# EasyEDA Pro project KEYBOARD_V2.eprj, schematic Schematic1
Board Name: Board1; Create Date: 2026-10-05; Page Name: P1; Project Name: KEYBOARD_V2; Schematic Name: Schematic1; Update Date: 2026-10-07; Company: 嘉立创EDA; Page Size: A4; Version: V1.0
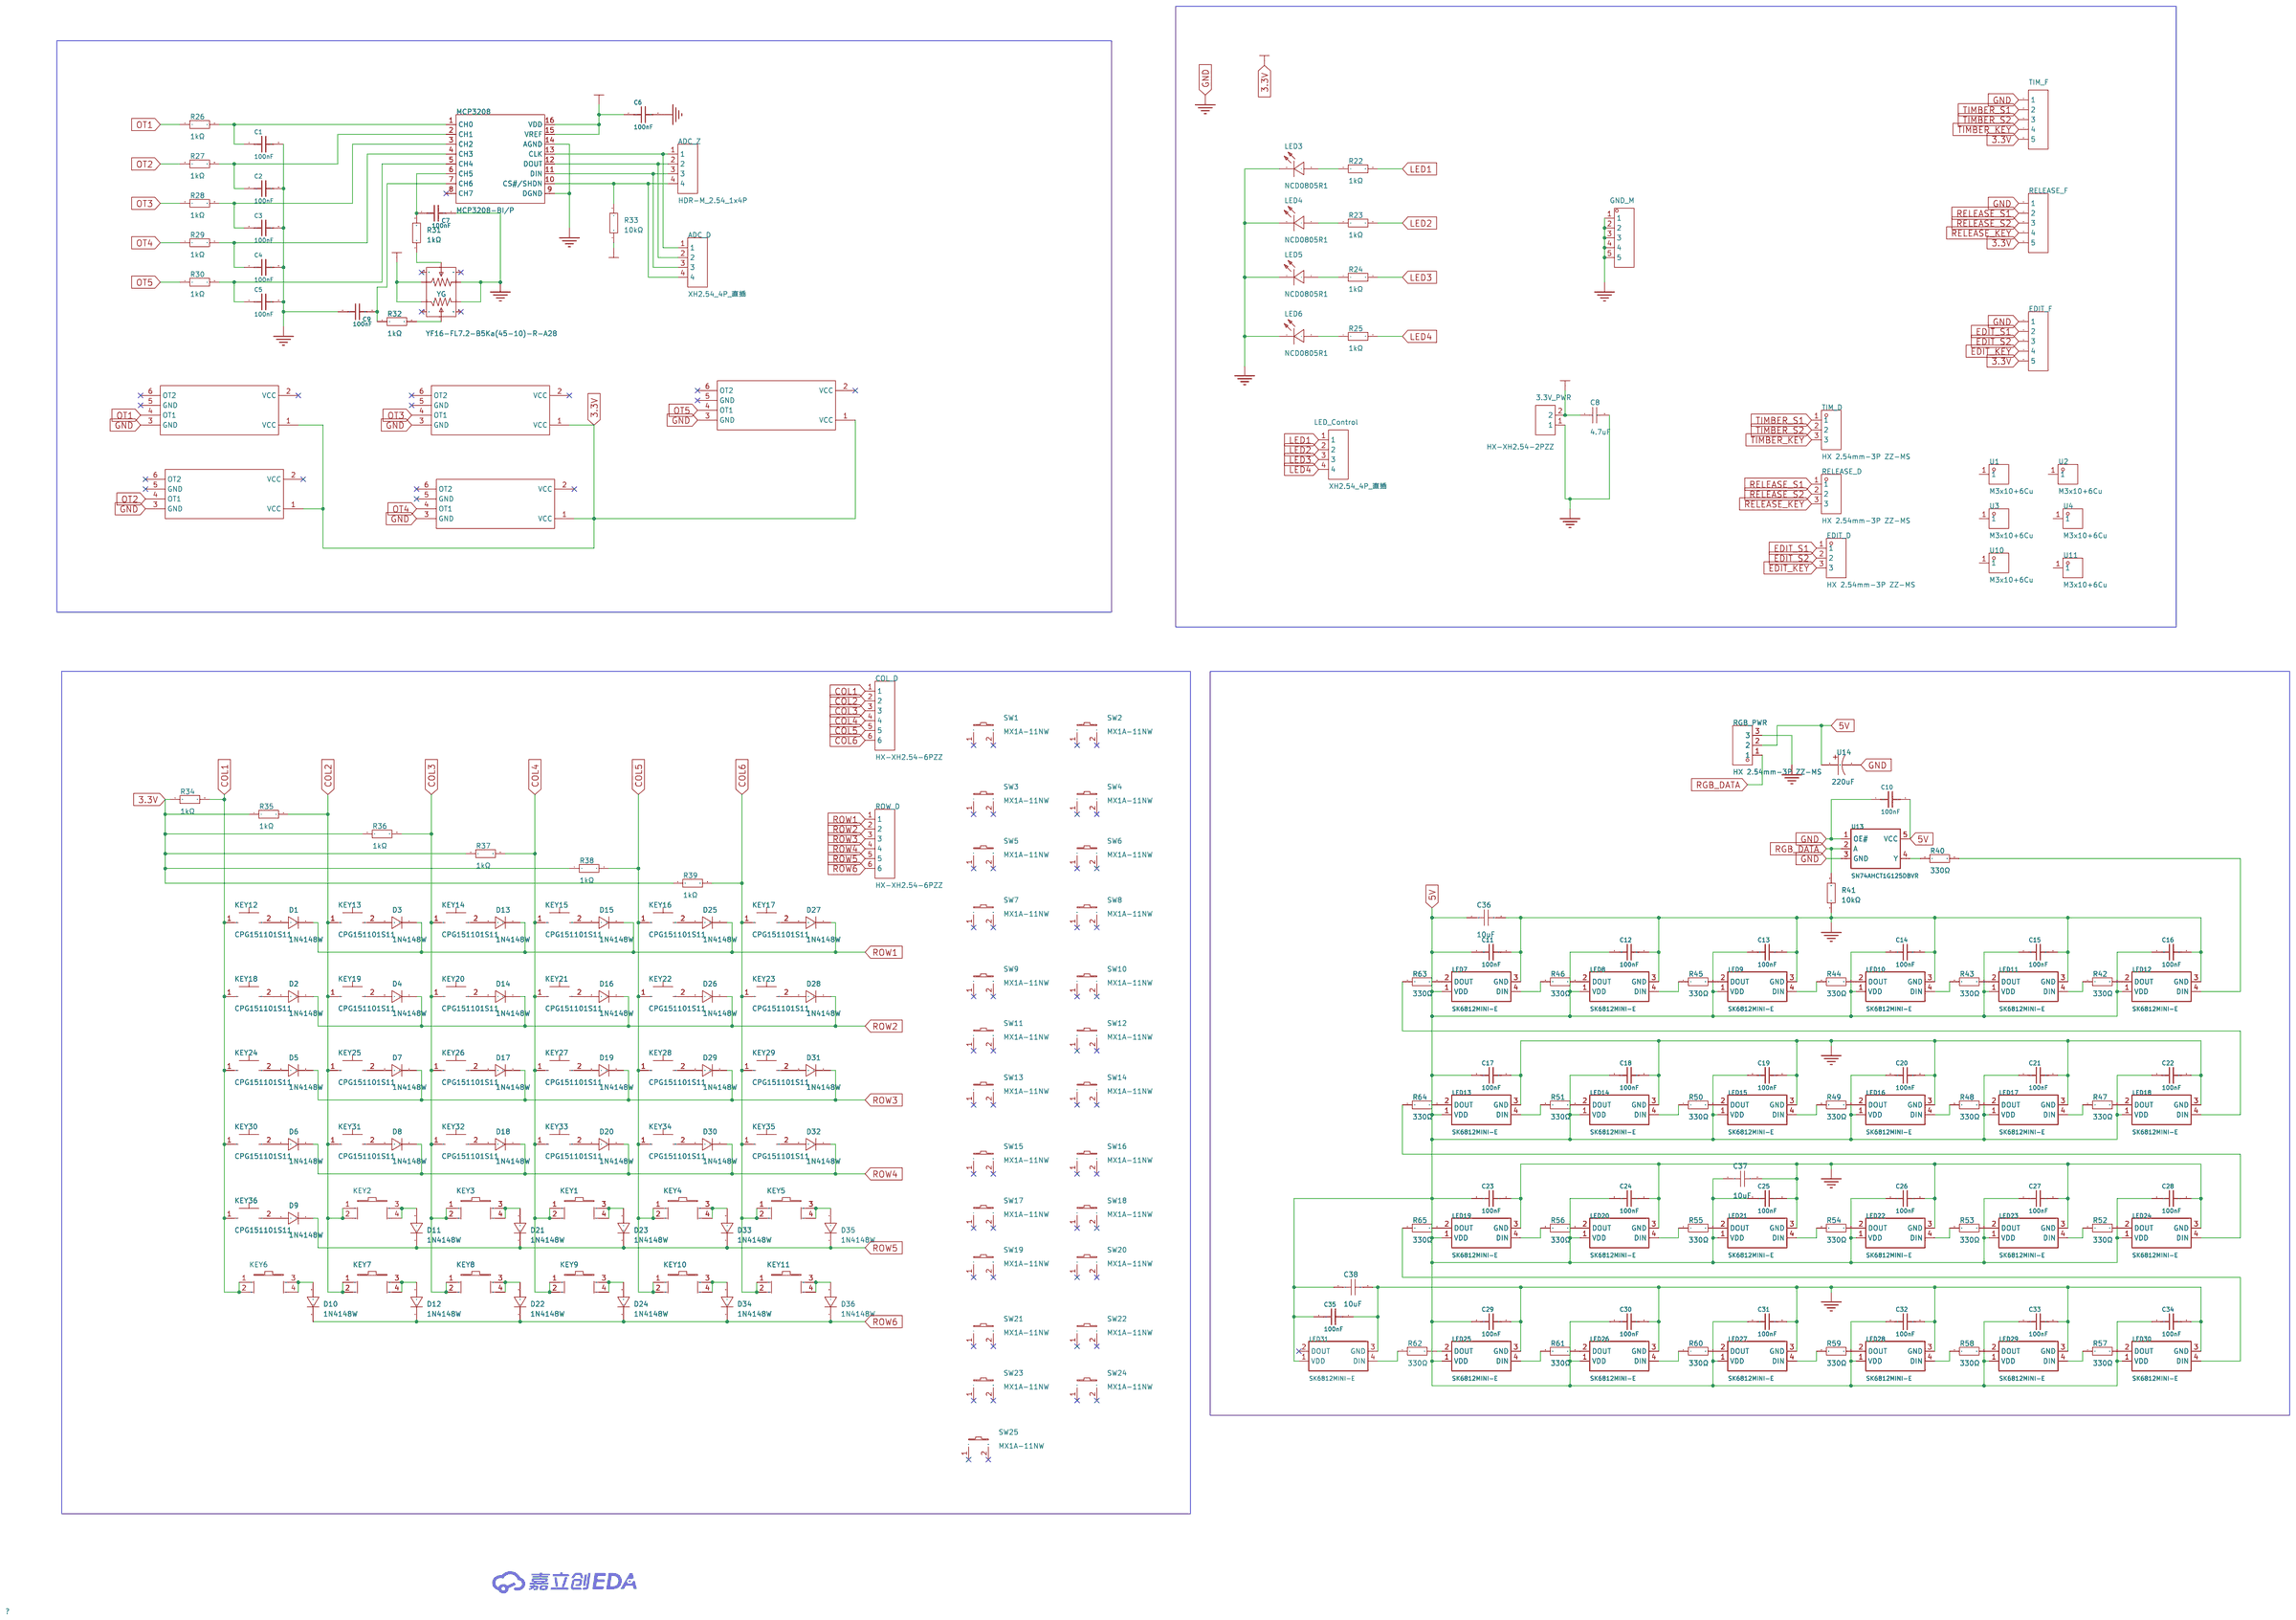
[diagram p0: schematic sheet]

## Parts
3.3V_PWR  HX-XH2.54-2PZZ  [CONN-TH_2P-P2.50_HX-2.54MM-2P-ZZ-MS]
ADC_D  XH2.54_4P_直插  [CONN-TH_4P-P2.50-XH2.54-4P]
ADC_Z  HDR-M_2.54_1x4P  [HDR-TH_HDR-M_2.54_1X4P]
C1  100nF  [C0603]
C2  100nF  [C0603]
C3  100nF  [C0603]
C4  100nF  [C0603]
C5  100nF  [C0603]
C6  100nF  [C0603]
C7  100nF  [C0603]
C8  4.7uF  [C0805]
C9  100nF  [C0603]
C10  100nF  [C0603]
C11  100nF  [C0603]
C12  100nF  [C0603]
C13  100nF  [C0603]
C14  100nF  [C0603]
C15  100nF  [C0603]
C16  100nF  [C0603]
C17  100nF  [C0603]
C18  100nF  [C0603]
C19  100nF  [C0603]
C20  100nF  [C0603]
C21  100nF  [C0603]
C22  100nF  [C0603]
C23  100nF  [C0603]
C24  100nF  [C0603]
C25  100nF  [C0603]
C26  100nF  [C0603]
C27  100nF  [C0603]
C28  100nF  [C0603]
C29  100nF  [C0603]
C30  100nF  [C0603]
C31  100nF  [C0603]
C32  100nF  [C0603]
C33  100nF  [C0603]
C34  100nF  [C0603]
C35  100nF  [C0603]
C36  10uF  [C0805]
C37  10uF  [C0805]
C38  10uF  [C0805]
COL_D  HX-XH2.54-6PZZ  [CONN-TH_6P-P2.50_BX-XH2.54-6PZZ]
D1  1N4148W  [SOD-123F_L2.7-W1.6-LS3.8-RD]
D2  1N4148W  [SOD-123F_L2.7-W1.6-LS3.8-RD]
D3  1N4148W  [SOD-123F_L2.7-W1.6-LS3.8-RD]
D4  1N4148W  [SOD-123F_L2.7-W1.6-LS3.8-RD]
D5  1N4148W  [SOD-123F_L2.7-W1.6-LS3.8-RD]
D6  1N4148W  [SOD-123F_L2.7-W1.6-LS3.8-RD]
D7  1N4148W  [SOD-123F_L2.7-W1.6-LS3.8-RD]
D8  1N4148W  [SOD-123F_L2.7-W1.6-LS3.8-RD]
D9  1N4148W  [SOD-123F_L2.7-W1.6-LS3.8-RD]
D10  1N4148W  [SOD-123F_L2.7-W1.6-LS3.8-RD]
D11  1N4148W  [SOD-123F_L2.7-W1.6-LS3.8-RD]
D12  1N4148W  [SOD-123F_L2.7-W1.6-LS3.8-RD]
D13  1N4148W  [SOD-123F_L2.7-W1.6-LS3.8-RD]
D14  1N4148W  [SOD-123F_L2.7-W1.6-LS3.8-RD]
D15  1N4148W  [SOD-123F_L2.7-W1.6-LS3.8-RD]
D16  1N4148W  [SOD-123F_L2.7-W1.6-LS3.8-RD]
D17  1N4148W  [SOD-123F_L2.7-W1.6-LS3.8-RD]
D18  1N4148W  [SOD-123F_L2.7-W1.6-LS3.8-RD]
D19  1N4148W  [SOD-123F_L2.7-W1.6-LS3.8-RD]
D20  1N4148W  [SOD-123F_L2.7-W1.6-LS3.8-RD]
D21  1N4148W  [SOD-123F_L2.7-W1.6-LS3.8-RD]
D22  1N4148W  [SOD-123F_L2.7-W1.6-LS3.8-RD]
D23  1N4148W  [SOD-123F_L2.7-W1.6-LS3.8-RD]
D24  1N4148W  [SOD-123F_L2.7-W1.6-LS3.8-RD]
D25  1N4148W  [SOD-123F_L2.7-W1.6-LS3.8-RD]
D26  1N4148W  [SOD-123F_L2.7-W1.6-LS3.8-RD]
D27  1N4148W  [SOD-123F_L2.7-W1.6-LS3.8-RD]
D28  1N4148W  [SOD-123F_L2.7-W1.6-LS3.8-RD]
D29  1N4148W  [SOD-123F_L2.7-W1.6-LS3.8-RD]
D30  1N4148W  [SOD-123F_L2.7-W1.6-LS3.8-RD]
D31  1N4148W  [SOD-123F_L2.7-W1.6-LS3.8-RD]
D32  1N4148W  [SOD-123F_L2.7-W1.6-LS3.8-RD]
D33  1N4148W  [SOD-123F_L2.7-W1.6-LS3.8-RD]
D34  1N4148W  [SOD-123F_L2.7-W1.6-LS3.8-RD]
D35  1N4148W  [SOD-123F_L2.7-W1.6-LS3.8-RD]
D36  1N4148W  [SOD-123F_L2.7-W1.6-LS3.8-RD]
EDIT_D  HX 2.54mm-3P ZZ-MS  [CONN-TH_3P-P2.50_HX-2.54MM-3P-ZZ-MS]
EDIT_F  -  [HDR-TH_5P-P2.54-V-F]
GND_M  -  [HDR-TH_5P-P2.54-V-M]
KEY1  轻触开关12x12x9直插  [KEY-TH_4P-L12.0-W12.0-P5.00-LS12.5]
KEY2  轻触开关12x12x9直插  [KEY-TH_4P-L12.0-W12.0-P5.00-LS12.5]
KEY3  轻触开关12x12x9直插  [KEY-TH_4P-L12.0-W12.0-P5.00-LS12.5]
KEY4  轻触开关12x12x9直插  [KEY-TH_4P-L12.0-W12.0-P5.00-LS12.5]
KEY5  轻触开关12x12x9直插  [KEY-TH_4P-L12.0-W12.0-P5.00-LS12.5]
KEY6  轻触开关12x12x9直插  [KEY-TH_4P-L12.0-W12.0-P5.00-LS12.5]
KEY7  轻触开关12x12x9直插  [KEY-TH_4P-L12.0-W12.0-P5.00-LS12.5]
KEY8  轻触开关12x12x9直插  [KEY-TH_4P-L12.0-W12.0-P5.00-LS12.5]
KEY9  轻触开关12x12x9直插  [KEY-TH_4P-L12.0-W12.0-P5.00-LS12.5]
KEY10  轻触开关12x12x9直插  [KEY-TH_4P-L12.0-W12.0-P5.00-LS12.5]
KEY11  轻触开关12x12x9直插  [KEY-TH_4P-L12.0-W12.0-P5.00-LS12.5]
KEY12  CPG151101S11  [TH_L10.9-W5.9-CPG151101S11]
KEY13  CPG151101S11  [TH_L10.9-W5.9-CPG151101S11]
KEY14  CPG151101S11  [TH_L10.9-W5.9-CPG151101S11]
KEY15  CPG151101S11  [TH_L10.9-W5.9-CPG151101S11]
KEY16  CPG151101S11  [TH_L10.9-W5.9-CPG151101S11]
KEY17  CPG151101S11  [TH_L10.9-W5.9-CPG151101S11]
KEY18  CPG151101S11  [TH_L10.9-W5.9-CPG151101S11]
KEY19  CPG151101S11  [TH_L10.9-W5.9-CPG151101S11]
KEY20  CPG151101S11  [TH_L10.9-W5.9-CPG151101S11]
KEY21  CPG151101S11  [TH_L10.9-W5.9-CPG151101S11]
KEY22  CPG151101S11  [TH_L10.9-W5.9-CPG151101S11]
KEY23  CPG151101S11  [TH_L10.9-W5.9-CPG151101S11]
KEY24  CPG151101S11  [TH_L10.9-W5.9-CPG151101S11]
KEY25  CPG151101S11  [TH_L10.9-W5.9-CPG151101S11]
KEY26  CPG151101S11  [TH_L10.9-W5.9-CPG151101S11]
KEY27  CPG151101S11  [TH_L10.9-W5.9-CPG151101S11]
KEY28  CPG151101S11  [TH_L10.9-W5.9-CPG151101S11]
KEY29  CPG151101S11  [TH_L10.9-W5.9-CPG151101S11]
KEY30  CPG151101S11  [TH_L10.9-W5.9-CPG151101S11]
KEY31  CPG151101S11  [TH_L10.9-W5.9-CPG151101S11]
KEY32  CPG151101S11  [TH_L10.9-W5.9-CPG151101S11]
KEY33  CPG151101S11  [TH_L10.9-W5.9-CPG151101S11]
KEY34  CPG151101S11  [TH_L10.9-W5.9-CPG151101S11]
KEY35  CPG151101S11  [TH_L10.9-W5.9-CPG151101S11]
KEY36  CPG151101S11  [TH_L10.9-W5.9-CPG151101S11]
LED3  NCD0805R1  [LED0805-RD]
LED4  NCD0805R1  [LED0805-RD]
LED5  NCD0805R1  [LED0805-RD]
LED6  NCD0805R1  [LED0805-RD]
LED7  SK6812MINI-E  [LED-SMD_4P-L3.2-W2.8-LS5.9_SK6812MINI-E]
LED8  SK6812MINI-E  [LED-SMD_4P-L3.2-W2.8-LS5.9_SK6812MINI-E]
LED9  SK6812MINI-E  [LED-SMD_4P-L3.2-W2.8-LS5.9_SK6812MINI-E]
LED10  SK6812MINI-E  [LED-SMD_4P-L3.2-W2.8-LS5.9_SK6812MINI-E]
LED11  SK6812MINI-E  [LED-SMD_4P-L3.2-W2.8-LS5.9_SK6812MINI-E]
LED12  SK6812MINI-E  [LED-SMD_4P-L3.2-W2.8-LS5.9_SK6812MINI-E]
LED13  SK6812MINI-E  [LED-SMD_4P-L3.2-W2.8-LS5.9_SK6812MINI-E]
LED14  SK6812MINI-E  [LED-SMD_4P-L3.2-W2.8-LS5.9_SK6812MINI-E]
LED15  SK6812MINI-E  [LED-SMD_4P-L3.2-W2.8-LS5.9_SK6812MINI-E]
LED16  SK6812MINI-E  [LED-SMD_4P-L3.2-W2.8-LS5.9_SK6812MINI-E]
LED17  SK6812MINI-E  [LED-SMD_4P-L3.2-W2.8-LS5.9_SK6812MINI-E]
LED18  SK6812MINI-E  [LED-SMD_4P-L3.2-W2.8-LS5.9_SK6812MINI-E]
LED19  SK6812MINI-E  [LED-SMD_4P-L3.2-W2.8-LS5.9_SK6812MINI-E]
LED20  SK6812MINI-E  [LED-SMD_4P-L3.2-W2.8-LS5.9_SK6812MINI-E]
LED21  SK6812MINI-E  [LED-SMD_4P-L3.2-W2.8-LS5.9_SK6812MINI-E]
LED22  SK6812MINI-E  [LED-SMD_4P-L3.2-W2.8-LS5.9_SK6812MINI-E]
LED23  SK6812MINI-E  [LED-SMD_4P-L3.2-W2.8-LS5.9_SK6812MINI-E]
LED24  SK6812MINI-E  [LED-SMD_4P-L3.2-W2.8-LS5.9_SK6812MINI-E]
LED25  SK6812MINI-E  [LED-SMD_4P-L3.2-W2.8-LS5.9_SK6812MINI-E]
LED26  SK6812MINI-E  [LED-SMD_4P-L3.2-W2.8-LS5.9_SK6812MINI-E]
LED27  SK6812MINI-E  [LED-SMD_4P-L3.2-W2.8-LS5.9_SK6812MINI-E]
LED28  SK6812MINI-E  [LED-SMD_4P-L3.2-W2.8-LS5.9_SK6812MINI-E]
LED29  SK6812MINI-E  [LED-SMD_4P-L3.2-W2.8-LS5.9_SK6812MINI-E]
LED30  SK6812MINI-E  [LED-SMD_4P-L3.2-W2.8-LS5.9_SK6812MINI-E]
LED31  SK6812MINI-E  [LED-SMD_4P-L3.2-W2.8-LS5.9_SK6812MINI-E]
LED_Control  XH2.54_4P_直插  [CONN-TH_4P-P2.50-XH2.54-4P]
MCP3208  MCP3208-BI/P  [PDIP-16_L19.3-W6.4-P2.54-LS7.94-BL]
R22  1kΩ  [R0805]
R23  1kΩ  [R0805]
R24  1kΩ  [R0805]
R25  1kΩ  [R0805]
R26  1kΩ  [R0805]
R27  1kΩ  [R0805]
R28  1kΩ  [R0805]
R29  1kΩ  [R0805]
R30  1kΩ  [R0805]
R31  1kΩ  [R0805]
R32  1kΩ  [R0805]
R33  10kΩ  [R0805]
R34  1kΩ  [R0805]
R35  1kΩ  [R0805]
R36  1kΩ  [R0805]
R37  1kΩ  [R0805]
R38  1kΩ  [R0805]
R39  1kΩ  [R0805]
R40  330Ω  [R0805]
R41  10kΩ  [R0805]
R42  330Ω  [R0805]
R43  330Ω  [R0805]
R44  330Ω  [R0805]
R45  330Ω  [R0805]
R46  330Ω  [R0805]
R47  330Ω  [R0805]
R48  330Ω  [R0805]
R49  330Ω  [R0805]
R50  330Ω  [R0805]
R51  330Ω  [R0805]
R52  330Ω  [R0805]
R53  330Ω  [R0805]
R54  330Ω  [R0805]
R55  330Ω  [R0805]
R56  330Ω  [R0805]
R57  330Ω  [R0805]
R58  330Ω  [R0805]
R59  330Ω  [R0805]
R60  330Ω  [R0805]
R61  330Ω  [R0805]
R62  330Ω  [R0805]
R63  330Ω  [R0805]
R64  330Ω  [R0805]
R65  330Ω  [R0805]
RELEASE_D  HX 2.54mm-3P ZZ-MS  [CONN-TH_3P-P2.50_HX-2.54MM-3P-ZZ-MS]
RELEASE_F  -  [HDR-TH_5P-P2.54-V-F]
RGB_PWR  HX 2.54mm-3P ZZ-MS  [CONN-TH_3P-P2.50_HX-2.54MM-3P-ZZ-MS]
ROW_D  HX-XH2.54-6PZZ  [CONN-TH_6P-P2.50_BX-XH2.54-6PZZ]
SW1  MX1A-11NW  [SW-TH_MX1A-11NW]
SW2  MX1A-11NW  [SW-TH_MX1A-11NW]
SW3  MX1A-11NW  [SW-TH_MX1A-11NW]
SW4  MX1A-11NW  [SW-TH_MX1A-11NW]
SW5  MX1A-11NW  [SW-TH_MX1A-11NW]
SW6  MX1A-11NW  [SW-TH_MX1A-11NW]
SW7  MX1A-11NW  [SW-TH_MX1A-11NW]
SW8  MX1A-11NW  [SW-TH_MX1A-11NW]
SW9  MX1A-11NW  [SW-TH_MX1A-11NW]
SW10  MX1A-11NW  [SW-TH_MX1A-11NW]
SW11  MX1A-11NW  [SW-TH_MX1A-11NW]
SW12  MX1A-11NW  [SW-TH_MX1A-11NW]
SW13  MX1A-11NW  [SW-TH_MX1A-11NW]
SW14  MX1A-11NW  [SW-TH_MX1A-11NW]
SW15  MX1A-11NW  [SW-TH_MX1A-11NW]
SW16  MX1A-11NW  [SW-TH_MX1A-11NW]
SW17  MX1A-11NW  [SW-TH_MX1A-11NW]
SW18  MX1A-11NW  [SW-TH_MX1A-11NW]
SW19  MX1A-11NW  [SW-TH_MX1A-11NW]
SW20  MX1A-11NW  [SW-TH_MX1A-11NW]
SW21  MX1A-11NW  [SW-TH_MX1A-11NW]
SW22  MX1A-11NW  [SW-TH_MX1A-11NW]
SW23  MX1A-11NW  [SW-TH_MX1A-11NW]
SW24  MX1A-11NW  [SW-TH_MX1A-11NW]
SW25  MX1A-11NW  [SW-TH_MX1A-11NW]
TIM_D  HX 2.54mm-3P ZZ-MS  [CONN-TH_3P-P2.50_HX-2.54MM-3P-ZZ-MS]
TIM_F  -  [HDR-TH_5P-P2.54-V-F]
U1  M3x10+6Cu  [SMD_L4.7-W4.7-D3.0]
U2  M3x10+6Cu  [SMD_L4.7-W4.7-D3.0]
U3  M3x10+6Cu  [SMD_L4.7-W4.7-D3.0]
U4  M3x10+6Cu  [SMD_L4.7-W4.7-D3.0]
U5  -  [Potentiometer]
U6  -  [Potentiometer]
U7  -  [Potentiometer]
U8  -  [Potentiometer]
U9  -  [Potentiometer]
U10  M3x10+6Cu  [SMD_L4.7-W4.7-D3.0]
U11  M3x10+6Cu  [SMD_L4.7-W4.7-D3.0]
U13  SN74AHCT1G125DBVR  [SOT-23-5_L3.0-W1.7-P0.95-LS2.8-BR]
U14  220uF  [CAP-TH_BD10.0-P5.00-D0.6-FD]
YG  YF16-FL7.2-B5Ka(45-10)-R-A28  [JOYTICK-TH_YF16-DFL7.2-B5KO-45-10-B5KO-55--RG-A22]

## Library data of the parts
3.3V_PWR = HX-XH2.54-2PZZ: 插针结构:1x2P;间距:2.54mm;安装方式:直插;参考系列:XH;总PIN数:2P;排数:1;每排PIN数:2;行距:-;额定电流:3A;触头材质:黄铜;触头镀层:锡;工作温度:-25℃~+85℃;; LCSC Part Name: 1x2P 间距:2.54mm 直插 系列:XH; Supplier Part: C42391660; Manufacturer: hanxia(韩下); Supplier Footprint: 插件,P=2.54mm; JLCPCB Part Class: 扩展库; Datasheet: https://item.szlcsc.com/datasheet/HX-XH2.54-2PZZ/44326932.html; Supplier: LCSC; Pins Structure: 1x2P; Pitch: 2.54mm; Mounting Type: 直插; Reference Series: XH; Number of Pins: 2P; Number of Rows: 1; Number of PINs Per Row: 2; Current Rating: 3A; Contact Material: 黄铜; Contact Plating: 锡; Operating Temperature: -25℃~+85℃; Voltage Rating: 250V; Plastic Material: PA66; Flame Retardant Rating: UL94V-0; Color: 白色
ADC_D LED_Control = XH2.54_4P_直插: Supplier Part: C9900008616; Supplier Footprint: XH2.54_4P; JLCPCB Part Class: 扩展库; Supplier: LCSC
ADC_Z = HDR-M_2.54_1x4P_C9900236824: Supplier Part: C9900236824; Supplier Footprint: HDR-TH_4P-P2.54-V-M; JLCPCB Part Class: 扩展库; Supplier: LCSC
C1-C7 C9-C35 = CC0603KRX7R9BB104: 容值:100nF;精度:±10%;额定电压:50V;温度系数:X7R;; LCSC Part Name: 100nF ±10% 50V; Supplier Part: C14663; Manufacturer: YAGEO(国巨); Supplier Footprint: 0603; JLCPCB Part Class: 基础库; Datasheet: https://item.szlcsc.com/datasheet/CC0603KRX7R9BB104/15331.html; Supplier: LCSC; Tolerance: ±10%; Voltage Rating: 50V; Temperature Coefficient: X7R
C8 = CL21A475KAQNNNE: 容值:4.7uF;精度:±10%;额定电压:25V;温度系数:X5R;; LCSC Part Name: 4.7uF ±10% 25V; Supplier Part: C1779; Manufacturer: SAMSUNG(三星); Supplier Footprint: 0805; JLCPCB Part Class: 基础库; Datasheet: https://item.szlcsc.com/datasheet/CL21A475KAQNNNE/2131.html; Supplier: LCSC; Tolerance: ±10%; Voltage Rating: 25V; Temperature Coefficient: X5R
C36-C38 = CL21A106KAYNNNE_C15850: LCSC Part Name: 10uF ±10% 25V; Supplier Part: C15850; Manufacturer: SAMSUNG(三星); Manufacturer Part: CL21A106KAYNNNE; Supplier Footprint: 0805; JLCPCB Part Class: 基础库; Datasheet: https://item.szlcsc.com/datasheet/CL21A106KAYNNNE/16532.html; Supplier: LCSC; Tolerance: ±10%; Voltage Rating: 25V; Temperature Coefficient: X5R
COL_D ROW_D = HX-XH2.54-6PZZ: 插针结构:1x6P;间距:2.54mm;安装方式:直插;参考系列:XH;总PIN数:6P;排数:1;每排PIN数:6;行距:-;额定电流:3A;触头材质:黄铜;触头镀层:锡;工作温度:-25℃~+85℃;; LCSC Part Name: 1x6P 间距:2.54mm 直插 系列:XH; Supplier Part: C42391664; Manufacturer: hanxia(韩下); Supplier Footprint: 插件,P=2.5mm; JLCPCB Part Class: 扩展库; Datasheet: https://item.szlcsc.com/datasheet/HX-XH2.54-6PZZ/44326936.html; Supplier: LCSC; Pins Structure: 1x6P; Pitch: 2.54mm; Mounting Type: 直插; Reference Series: XH; Number of Pins: 6P; Number of Rows: 1; Number of PINs Per Row: 6; Current Rating: 3A; Contact Material: 黄铜; Contact Plating: 锡; Operating Temperature: -25℃~+85℃; Voltage Rating: 250V; Plastic Material: PA66; Flame Retardant Rating: UL94V-0; Color: 白色
D1-D36 = 1N4148W_C81598: 二极管配置:独立式;整流电流:150mA;直流反向耐压(Vr):75V;正向压降(Vf):1V@50mA;反向恢复时间(Trr):4ns;; LCSC Part Name: 75V 150mA; Supplier Part: C81598; Manufacturer: ST(先科); Supplier Footprint: SOD-123; JLCPCB Part Class: 基础库; Datasheet: https://item.szlcsc.com/datasheet/1N4148W/82750.html; Supplier: LCSC; Diode Configuration: 独立式; Pd - Power Dissipation: 400mW; Current - Rectified: 150mA; Voltage - DC Reverse(Vr): 75V; Voltage - Forward(Vf@If): 1V@50mA; Non-Repetitive Peak Forward Surge Current: 1A; Reverse Leakage Current (Ir): 1uA@75V; Reverse Recovery Time (trr): 4ns
EDIT_D RELEASE_D RGB_PWR TIM_D = HX 2.54mm-3P ZZ-MS: 插针结构:1x3P;间距:2.5mm;安装方式:直插;参考系列:XH;总PIN数:3P;排数:1;每排PIN数:3;行距:-;额定电流:3A;触头材质:黄铜;触头镀层:锡;工作温度:-25℃~+85℃;; LCSC Part Name: 1x3P 间距:2.5mm 直插 系列:XH; Supplier Part: C7543456; Manufacturer: hanxia(韩下); Supplier Footprint: 插件,P=2.5mm; JLCPCB Part Class: 扩展库; Datasheet: https://item.szlcsc.com/datasheet/HX%25202.54mm-3P%2520ZZ-MS/8648062.html; Supplier: LCSC; Pins Structure: 1x3P; Pitch: 2.5mm; Mounting Type: 直插; Reference Series: XH; Number of Pins: 3P; Number of Rows: 1; Number of PINs Per Row: 3; Current Rating: 3A; Contact Material: 黄铜; Contact Plating: 锡; Operating Temperature: -25℃~+85℃; Voltage Rating: 250V; Plastic Material: PA66; Flame Retardant Rating: UL94V-0; Color: 米色
EDIT_F RELEASE_F TIM_F = HDR-F_2.54_1x5P: Supplier Part: C50950; Supplier Footprint: 插件; JLCPCB Part Class: 扩展库
GND_M = HDR-M_2.54_1x5P: Supplier Part: C358687; Supplier Footprint: 插件; JLCPCB Part Class: 扩展库
KEY1-KEY11 = 轻触开关12x12x9直插: 塑料头; LCSC Part Name: 12x12x9; Supplier Part: C27371; Supplier Footprint: 插件; JLCPCB Part Class: 扩展库; Supplier: LCSC
KEY12-KEY36 = CPG151101S11: LCSC Part Name: 键盘轴连接器 停产; Supplier Part: C2803348; Manufacturer: Kailh(凯华); Supplier Footprint: SMD; JLCPCB Part Class: 扩展库; Datasheet: https://atta.szlcsc.com/upload/public/pdf/source/20220228/B04A6FE76F6176D3365CC186B3035FED.pdf; Supplier: LCSC; Operating Voltage: 2V~12V
LED3-LED6 = NCD0805R1: 灯头类型:-;发光颜色:红色;正向压降(Vf):1.6V~2.6V;功率:65mW;测试电流:25mA;波长:615nm~630nm;二极管配置:独立二极管;透镜颜色:-;色温:-;发光强度:195mcd;发光角度:130°;载带方式:正贴;工作温度:-30℃~+85℃;; LCSC Part Name: 片式发光二极管; Supplier Part: C84256; Manufacturer: 国星光电; Supplier Footprint: 0805; JLCPCB Part Class: 基础库; Datasheet: https://item.szlcsc.com/datasheet/NCD0805R1/85425.html; Supplier: LCSC; Illumination Color: 红色; Voltage - Forward(Vf): 1.6V~2.6V; Power(Watts): 65mW; Test Current: 25mA; Wavelength - Dominant: 615nm~630nm; Peak Wavelength: 630nm; Diode Configuration: 独立二极管; Luminous Intensity: 195mcd; Viewing Angle: 130°; Mounting Style: 正贴; Operating Temperature: -30℃~+85℃; Half wave width: 15nm
LED7-LED31 = SK6812MINI-E_C5149201: LCSC Part Name: 工作电压5V、发光角度120°、灰度调节256级的RGB LED; Supplier Part: C5149201; Manufacturer: OPSCO(欧思科); Supplier Footprint: SMD; JLCPCB Part Class: 扩展库; Datasheet: https://item.szlcsc.com/datasheet/SK6812MINI-E/5773397.html; Supplier: LCSC; Dominant Wavelength - R: 620nm~625nm; Dominant Wavelength - G: 515nm~525nm; Dominant Wavelength - B: 460nm~470nm; Data Transmission Rate: 800Kbit/s; Voltage - Supply: 3.7V~5.5V; Quiescent Current: 0.6mA; Lens Color: 半透明透镜; ESD Withstand Voltage: 2000V; Operating Temperature: -40℃~+85℃; Fixed-Frequency Pwm Mode: 1kHz; Viewing Angle: 120°; Length: 3.2mm; Width: 1.78mm; Height: 2.8mm; Luminous Intensity - R: 160mcd~320mcd; Luminous Intensity - G: 815mcd~1275mcd; Luminous Intensity - B: 120mcd~240mcd
MCP3208 = MCP3208-BI/P: 分辨率(位):12;采样率:100kHz;工作电压:2.7V~5.5V;接口类型:SPI;; LCSC Part Name: 4通道/8通道12位A/D转换器，带SPI串行接口，具备片上采样和保持电路，采用低功耗CMOS技术; Supplier Part: C636800; Manufacturer: MICROCHIP(美国微芯); Supplier Footprint: PDIP-16; JLCPCB Part Class: 扩展库; Datasheet: https://item.szlcsc.com/datasheet/MCP3208-BI%252FP/675237.html; Supplier: LCSC; Resolution (Bits): 12; Sampling Rate: 100kHz; number of channels: 8; Voltage - Supply: 2.7V~5.5V; Interface: SPI; differential input: 是; Integral non - linearity: 1LSB; Operating Temperature: -40℃~+85℃; Clock/Oscillator: 外置; Clock Frequency: 2MHz；1MHz; Voltage Reference: 外置; Programmable Gain: 不支持; ADC architecture: SAR; Quiescent Current (Iq): 500nA; Features: 多路复用器；双极性输入; DNL (LSB): 0.5LSB
R22-R32 R34-R39 = 0805W8F1001T5E: LCSC Part Name: 1kΩ ±1% 125mW 厚膜电阻; Supplier Part: C17513; Manufacturer: UNI-ROYAL(厚声); Supplier Footprint: 0805; JLCPCB Part Class: 基础库; Datasheet: https://atta.szlcsc.com/upload/public/pdf/source/20200306/C422600_1E6D84923E4A46A82E41ADD87F860B5C.pdf; Supplier: LCSC; Type: 厚膜电阻; Tolerance: ±1%; Power(Watts): 125mW; Overload Voltage (Max): 150V; Temperature Coefficient: ±100ppm/℃; Operating Temperature Range: -55℃~+155℃
R33 R41 = 0805W8F1002T5E_C17414: LCSC Part Name: 厚膜电阻 10kΩ ±1%; Supplier Part: C17414; Manufacturer: UNI-ROYAL(厚声); Manufacturer Part: 0805W8F1002T5E; Supplier Footprint: 0805; JLCPCB Part Class: 基础库; Datasheet: https://item.szlcsc.com/datasheet/0805W8F1002T5E/18102.html; Supplier: LCSC; Type: 厚膜电阻; Tolerance: ±1%; Power(Watts): 125mW; Voltage-Supply(Max): 150V; Temperature Coefficient: ±100ppm/℃; Operating Temperature: -55℃~+155℃
R40 R42-R65 = 0805W8F3300T5E: LCSC Part Name: 厚膜电阻 330Ω ±1%; Supplier Part: C17630; Manufacturer: UNI-ROYAL(厚声); Supplier Footprint: 0805; JLCPCB Part Class: 基础库; Datasheet: https://item.szlcsc.com/datasheet/0805W8F3300T5E/18318.html; Supplier: LCSC; Type: 厚膜电阻; Tolerance: ±1%; Power(Watts): 125mW; Voltage-Supply(Max): 150V; Temperature Coefficient: ±100ppm/℃; Operating Temperature: -55℃~+155℃
SW1-SW25 = MX1A-11NW: Supplier Part: C3316924; Manufacturer: CHERRY; JLCPCB Part Class: 扩展库; Datasheet: https://item.szlcsc.com/datasheet/MX1A-11NW/3881518.html; Supplier: LCSC
U1-U4 U10 U11 = M3x10+6Cu: M3x10+6; LCSC Part Name: Shuntian(顺天五金) 单头六角隔离铜柱螺柱 M3X10+6 国标 黄铜 袋装; Supplier Part: C551322; Manufacturer: Shuntian(顺天五金); JLCPCB Part Class: 扩展库; Datasheet: https://item.szlcsc.com/datasheet/M3x10%252B6Cu/575012.html; Supplier: LCSC
U5-U9 = Potentiometer
U13 = SN74AHCT1G125DBVR: LCSC Part Name: 三态输出，单路总线缓冲门; Supplier Part: C7484; Manufacturer: TI(德州仪器); Supplier Footprint: SOT-23-5; JLCPCB Part Class: 扩展库; Datasheet: https://www.ti.com/cn/lit/ds/symlink/sn74ahct1g125.pdf; Supplier: LCSC; output type: 三态; Voltage - Supply: 4.5V~5.5V; Number of Elements: 1; Number of Bits per Element: 1; Channel Type: 单向; Current - Output Low(IOL): 8mA; Current - Output High(IOH): 8mA; Logic Family: 74AHCT; Operating Temperature: -40℃~+125℃; Quiescent Current: 10uA; Propagation Delay: 6.5ns@5V,15pF; Features: 输出使能
U14 = 50PK220MEFC10X12.5: LCSC Part Name: 220uF ±20% 50V; Supplier Part: C1594030; Manufacturer: Rubycon(红宝石); Supplier Footprint: 插件,D10xL12.5mm; JLCPCB Part Class: 扩展库; Supplier: LCSC; Tolerance: ±20%; Voltage Rating: 50V; Ripple Current: 522mA@10kHz; Pin Spacing: 5mm; Diameter: 10mm; Height - Seated (Max): 12.5mm; Lifetime: 2000hrs@85℃; Operating Temperature: -25℃~+85℃
YG = YF16-FL7.2-B5Ka(45-10)-R-A28: 摇杆电位器、操纵杆电位器，适用于航模玩具遥控器电位器、3D摇杆PS4手柄游戏机、无人机摇杆电位器、VR摇杆电位器、工业控制器; LCSC Part Name: 摇杆系列电位器; Supplier Part: C37323739; Manufacturer: YTL(亚特联); Supplier Footprint: 插件-10P,20.3x19.8mm; JLCPCB Part Class: 扩展库; Datasheet: https://item.szlcsc.com/datasheet/YF16-FL7.2-B5Ka(45-10)-R-A28/39051746.html; Supplier: LCSC; Total Resistance: 5kΩ; Operating Angle in Each Direction: 30°; Whether to Press Down: 支持; Toggle reset: 自复位; Mounting Type: 直插; Operating Temperature: -10℃~+70℃; Voltage Rating: 12V

## Nets
3.3V: 3.3V_PWR.2 C6.1 C8.1 EDIT_F.5 MCP3208.15(VREF) MCP3208.16(VDD) R33.1 R34.1 R35.1 R36.1 R37.1 R38.1 R39.1 RELEASE_F.5 TIM_F.5 U5.1(VCC) U6.1(VCC) U7.1(VCC) U8.1(VCC) U9.1(VCC) YG.3 YG.6
5V: C10.2 C11.2 C12.2 C13.1 C14.1 C15.1 C16.1 C17.2 C18.2 C19.1 C20.1 C21.1 C22.1 C23.2 C24.2 C25.1 C26.1 C27.1 C28.1 C29.2 C30.2 C31.1 C32.1 C33.1 C34.1 C35.2 C36.1 C37.1 C38.1 LED7.1(VDD) LED8.1(VDD) LED9.1(VDD) LED10.1(VDD) LED11.1(VDD) LED12.1(VDD) LED13.1(VDD) LED14.1(VDD) LED15.1(VDD) LED16.1(VDD) LED17.1(VDD) LED18.1(VDD) LED19.1(VDD) LED20.1(VDD) LED21.1(VDD) LED22.1(VDD) LED23.1(VDD) LED24.1(VDD) LED25.1(VDD) LED26.1(VDD) LED27.1(VDD) LED28.1(VDD) LED29.1(VDD) LED30.1(VDD) LED31.1(VDD) RGB_PWR.2 U13.5(VCC) U14.1
GND: 3.3V_PWR.1 C1.2 C2.2 C3.2 C4.2 C5.2 C6.2 C7.2 C8.2 C9.1 C10.1 C11.1 C12.1 C13.2 C14.2 C15.2 C16.2 C17.1 C18.1 C19.2 C20.2 C21.2 C22.2 C23.1 C24.1 C25.2 C26.2 C27.2 C28.2 C29.1 C30.1 C31.2 C32.2 C33.2 C34.2 C35.1 C36.2 C37.2 C38.2 EDIT_F.1 GND_M.1 GND_M.2 GND_M.3 GND_M.4 GND_M.5 LED3.1(-) LED4.1(-) LED5.1(-) LED6.1(-) LED7.3(GND) LED8.3(GND) LED9.3(GND) LED10.3(GND) LED11.3(GND) LED12.3(GND) LED13.3(GND) LED14.3(GND) LED15.3(GND) LED16.3(GND) LED17.3(GND) LED18.3(GND) LED19.3(GND) LED20.3(GND) LED21.3(GND) LED22.3(GND) LED23.3(GND) LED24.3(GND) LED25.3(GND) LED26.3(GND) LED27.3(GND) LED28.3(GND) LED29.3(GND) LED30.3(GND) LED31.3(GND) MCP3208.9(DGND) MCP3208.14(AGND) R41.1 RELEASE_F.1 RGB_PWR.3 TIM_F.1 U5.3(GND) U6.3(GND) U7.3(GND) U8.3(GND) U9.3(GND) U13.1(OE#) U13.3(GND) U14.2 YG.1 YG.4
COL1: COL_D.1 KEY6.1 KEY6.2 KEY12.1 KEY18.1 KEY24.1 KEY30.1 KEY36.1 R34.2
COL2: COL_D.2 KEY2.1 KEY2.2 KEY7.1 KEY7.2 KEY13.1 KEY19.1 KEY25.1 KEY31.1 R35.2
COL3: COL_D.3 KEY3.1 KEY3.2 KEY8.1 KEY8.2 KEY14.1 KEY20.1 KEY26.1 KEY32.1 R36.2
COL4: COL_D.4 KEY1.1 KEY1.2 KEY9.1 KEY9.2 KEY15.1 KEY21.1 KEY27.1 KEY33.1 R37.2
COL5: COL_D.5 KEY4.1 KEY4.2 KEY10.1 KEY10.2 KEY16.1 KEY22.1 KEY28.1 KEY34.1 R38.2
COL6: COL_D.6 KEY5.1 KEY5.2 KEY11.1 KEY11.2 KEY17.1 KEY23.1 KEY29.1 KEY35.1 R39.2
EDIT_KEY: EDIT_D.3 EDIT_F.4
EDIT_S1: EDIT_D.1 EDIT_F.2
EDIT_S2: EDIT_D.2 EDIT_F.3
LED1: LED_Control.1 R22.2
LED2: LED_Control.2 R23.2
LED3: LED_Control.3 R24.2
LED4: LED_Control.4 R25.2
OT1: R26.1 U5.4(OT1)
OT2: R27.1 U6.4(OT1)
OT3: R28.1 U7.4(OT1)
OT4: R29.1 U8.4(OT1)
OT5: R30.1 U9.4(OT1)
RELEASE_KEY: RELEASE_D.3 RELEASE_F.4
RELEASE_S1: RELEASE_D.1 RELEASE_F.2
RELEASE_S2: RELEASE_D.2 RELEASE_F.3
RGB_DATA: R41.2 RGB_PWR.1 U13.2(A)
ROW1: D1.1(K) D3.1(K) D13.1(K) D15.1(K) D25.1(K) D27.1(K) ROW_D.1
ROW2: D2.1(K) D4.1(K) D14.1(K) D16.1(K) D26.1(K) D28.1(K) ROW_D.2
ROW3: D5.1(K) D7.1(K) D17.1(K) D19.1(K) D29.1(K) D31.1(K) ROW_D.3
ROW4: D6.1(K) D8.1(K) D18.1(K) D20.1(K) D30.1(K) D32.1(K) ROW_D.4
ROW5: D9.1(K) D11.1(K) D21.1(K) D23.1(K) D33.1(K) D35.1(K) ROW_D.5
ROW6: D10.1(K) D12.1(K) D22.1(K) D24.1(K) D34.1(K) D36.1(K) ROW_D.6
TIMBER_KEY: TIM_D.3 TIM_F.4
TIMBER_S1: TIM_D.1 TIM_F.2
TIMBER_S2: TIM_D.2 TIM_F.3
$1N5525: D11.2(A) KEY2.3 KEY2.4
$1N5566: D21.2(A) KEY3.3 KEY3.4
$1N5571: D23.2(A) KEY1.3 KEY1.4
$1N5615: D33.2(A) KEY4.3 KEY4.4
$1N5656: D35.2(A) KEY5.3 KEY5.4
$1N5698: D10.2(A) KEY6.3 KEY6.4
$1N5739: D12.2(A) KEY7.3 KEY7.4
$1N5780: D22.2(A) KEY8.3 KEY8.4
$1N5824: D24.2(A) KEY9.3 KEY9.4
$1N5912: D34.2(A) KEY10.3 KEY10.4
$1N5916: D36.2(A) KEY11.3 KEY11.4
$1N7281: C1.1 MCP3208.1(CH0) R26.2
$1N7500: C2.1 MCP3208.2(CH1) R27.2
$1N7508: C3.1 MCP3208.3(CH2) R28.2
$1N7516: C4.1 MCP3208.4(CH3) R29.2
$1N7524: C5.1 MCP3208.5(CH4) R30.2
$1N8137: ADC_D.1 ADC_Z.1 MCP3208.13(CLK)
$1N8141: ADC_D.2 ADC_Z.2 MCP3208.12(DOUT)
$1N8146: ADC_D.3 ADC_Z.3 MCP3208.11(DIN)
$1N8151: ADC_D.4 ADC_Z.4 MCP3208.10(CS#/SHDN) R33.2
$1N8999: C7.1 MCP3208.6(CH5) R31.2
$1N9093: R31.1 YG.2
$1N13728: LED3.2(+) R22.1
$1N13732: LED4.2(+) R23.1
$1N13737: LED5.2(+) R24.1
$1N13742: LED6.2(+) R25.1
$1N45682: D1.2(A) KEY12.2
$1N45750: D3.2(A) KEY13.2
$1N45791: D13.2(A) KEY14.2
$1N45832: D15.2(A) KEY15.2
$1N45873: D25.2(A) KEY16.2
$1N45914: D27.2(A) KEY17.2
$1N45955: D2.2(A) KEY18.2
$1N45996: D4.2(A) KEY19.2
$1N46037: D14.2(A) KEY20.2
$1N46078: D16.2(A) KEY21.2
$1N46158: D26.2(A) KEY22.2
$1N46199: D28.2(A) KEY23.2
$1N46240: D5.2(A) KEY24.2
$1N46281: D7.2(A) KEY25.2
$1N46322: D17.2(A) KEY26.2
$1N46363: D19.2(A) KEY27.2
$1N46404: D29.2(A) KEY28.2
$1N46458: D31.2(A) KEY29.2
$1N46499: D6.2(A) KEY30.2
$1N46540: D8.2(A) KEY31.2
$1N46581: D18.2(A) KEY32.2
$1N46622: D20.2(A) KEY33.2
$1N46663: D30.2(A) KEY34.2
$1N46704: D32.2(A) KEY35.2
$1N46745: D9.2(A) KEY36.2
$1N46883: R32.2 YG.5
$1N46887: C9.2 MCP3208.7(CH6) R32.1
$1N51671: R40.1 U13.4(Y)
$1N51833: LED12.4(DIN) R40.2
$1N51836: LED7.4(DIN) R46.1
$1N51881: LED12.2(DOUT) R42.2
$1N51920: LED11.2(DOUT) R43.2
$1N51959: LED10.2(DOUT) R44.2
$1N52039: LED9.2(DOUT) R45.2
$1N52082: LED11.4(DIN) R42.1
$1N52087: LED10.4(DIN) R43.1
$1N52093: LED9.4(DIN) R44.1
$1N52099: LED8.4(DIN) R45.1
$1N52773: LED8.2(DOUT) R46.2
$1N53754: LED18.4(DIN) R63.1
$1N53756: LED13.4(DIN) R51.1
$1N53759: LED18.2(DOUT) R47.2
$1N53761: LED17.2(DOUT) R48.2
$1N53763: LED16.2(DOUT) R49.2
$1N53765: LED15.2(DOUT) R50.2
$1N53767: LED17.4(DIN) R47.1
$1N53770: LED16.4(DIN) R48.1
$1N53773: LED15.4(DIN) R49.1
$1N53776: LED14.4(DIN) R50.1
$1N53810: LED14.2(DOUT) R51.2
$1N54621: LED24.4(DIN) R64.1
$1N54623: LED19.4(DIN) R56.1
$1N54626: LED24.2(DOUT) R52.2
$1N54628: LED23.2(DOUT) R53.2
$1N54630: LED22.2(DOUT) R54.2
$1N54632: LED21.2(DOUT) R55.2
$1N54634: LED23.4(DIN) R52.1
$1N54637: LED22.4(DIN) R53.1
$1N54640: LED21.4(DIN) R54.1
$1N54643: LED20.4(DIN) R55.1
$1N54677: LED20.2(DOUT) R56.2
$1N55488: LED30.4(DIN) R65.1
$1N55490: LED25.4(DIN) R61.1
$1N55493: LED30.2(DOUT) R57.2
$1N55495: LED29.2(DOUT) R58.2
$1N55497: LED28.2(DOUT) R59.2
$1N55499: LED27.2(DOUT) R60.2
$1N55501: LED29.4(DIN) R57.1
$1N55504: LED28.4(DIN) R58.1
$1N55507: LED27.4(DIN) R59.1
$1N55510: LED26.4(DIN) R60.1
$1N55544: LED26.2(DOUT) R61.2
$1N56093: LED25.2(DOUT) R62.2
$1N56103: LED31.4(DIN) R62.1
$1N56351: LED7.2(DOUT) R63.2
$1N56390: LED13.2(DOUT) R64.2
$1N56429: LED19.2(DOUT) R65.2

Not connected (* = marked no-connect by the designer): LED31 2(DOUT)*; MCP3208 8(CH7)*; SW1 1* 2*; SW2 1* 2*; SW3 1* 2*; SW4 1* 2*; SW5 1* 2*; SW6 1* 2*; SW7 1* 2*; SW8 1* 2*; SW9 1* 2*; SW10 1* 2*; SW11 1* 2*; SW12 1* 2*; SW13 1* 2*; SW14 1* 2*; SW15 1* 2*; SW16 1* 2*; SW17 1* 2*; SW18 1* 2*; SW19 1* 2*; SW20 1* 2*; SW21 1* 2*; SW22 1* 2*; SW23 1* 2*; SW24 1* 2*; SW25 1* 2*; U1 1; U2 1; U3 1; U4 1; U5 2(VCC)* 5(GND)* 6(OT2)*; U6 2(VCC)* 5(GND)* 6(OT2)*; U7 2(VCC)* 5(GND)* 6(OT2)*; U8 2(VCC)* 5(GND)* 6(OT2)*; U9 2(VCC)* 5(GND)* 6(OT2)*; U10 1; U11 1; YG 7(shell)* 8(shell)* 9(shell)* 10(shell)*
